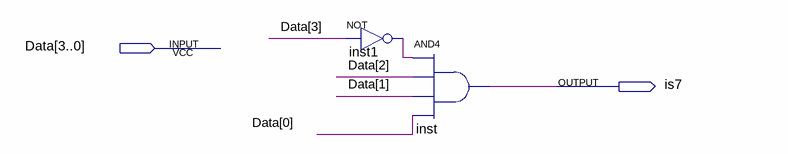
[diagram p0: schematic sheet]
// Quartus schematic check7.bdf as structural Verilog: 2 symbols, 2 pins
module check7 (
  input  [3:0] Data,
  output is7
);

  wire inst1_out;

  not inst1 (inst1_out, Data[3]);
  and inst (is7, inst1_out, Data[2], Data[1], Data[0]);
endmodule
